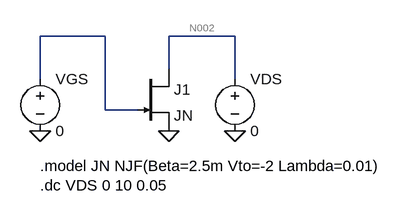
[diagram p0: schematic Ex01.asc]
Ex01.asc, the LTspice schematic file:
Version 4
SHEET 1 880 680
WIRE 100 216 100 150
WIRE 100 150 200 150
WIRE 200 150 200 264
WIRE 200 264 250 264
WIRE 298 200 298 150
WIRE 298 150 400 150
WIRE 400 150 400 216
FLAG 100 296 0
FLAG 298 296 0
FLAG 400 296 0
SYMBOL voltage 100 200 R0
SYMATTR InstName VGS
SYMATTR Value 0
SYMBOL njf 250 200 R0
SYMATTR InstName J1
SYMATTR Value JN
SYMBOL voltage 400 200 R0
SYMATTR InstName VDS
SYMATTR Value 0
TEXT 100 350 Left 2 !.model JN NJF(Beta=2.5m Vto=-2 Lambda=0.01)
TEXT 100 380 Left 2 !.dc VDS 0 10 0.05

The netlist it stands for:
* Ex01.asc
VGS N001 0 0
J1 N002 N001 0 JN
VDS N002 0 0
.model NJF NJF
.model PJF PJF
.lib standard.jft
.model JN NJF(Beta=2.5m Vto=-2 Lambda=0.01)
.dc VDS 0 10 0.05
.backanno
.end

* Results of the author's LTspice run, read from the files saved beside the schematic
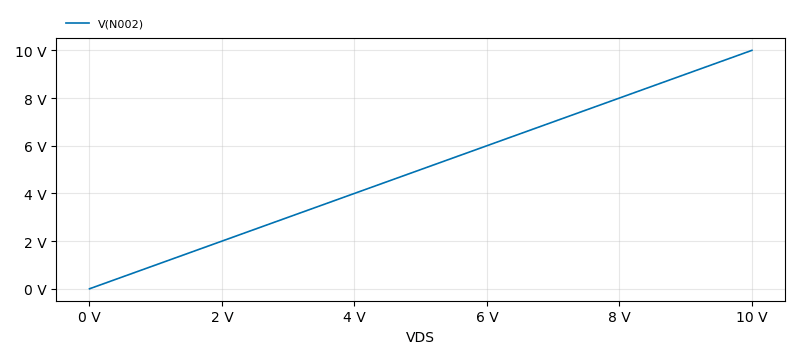
[diagram p1: DC transfer characteristic of Ex01.asc, plotted from the saved traces]
* DC transfer characteristic, 1 run:
*   V(N002): 0 V at VDS=0 V, 10 V at VDS=10 V, min 0 V, max 10 V